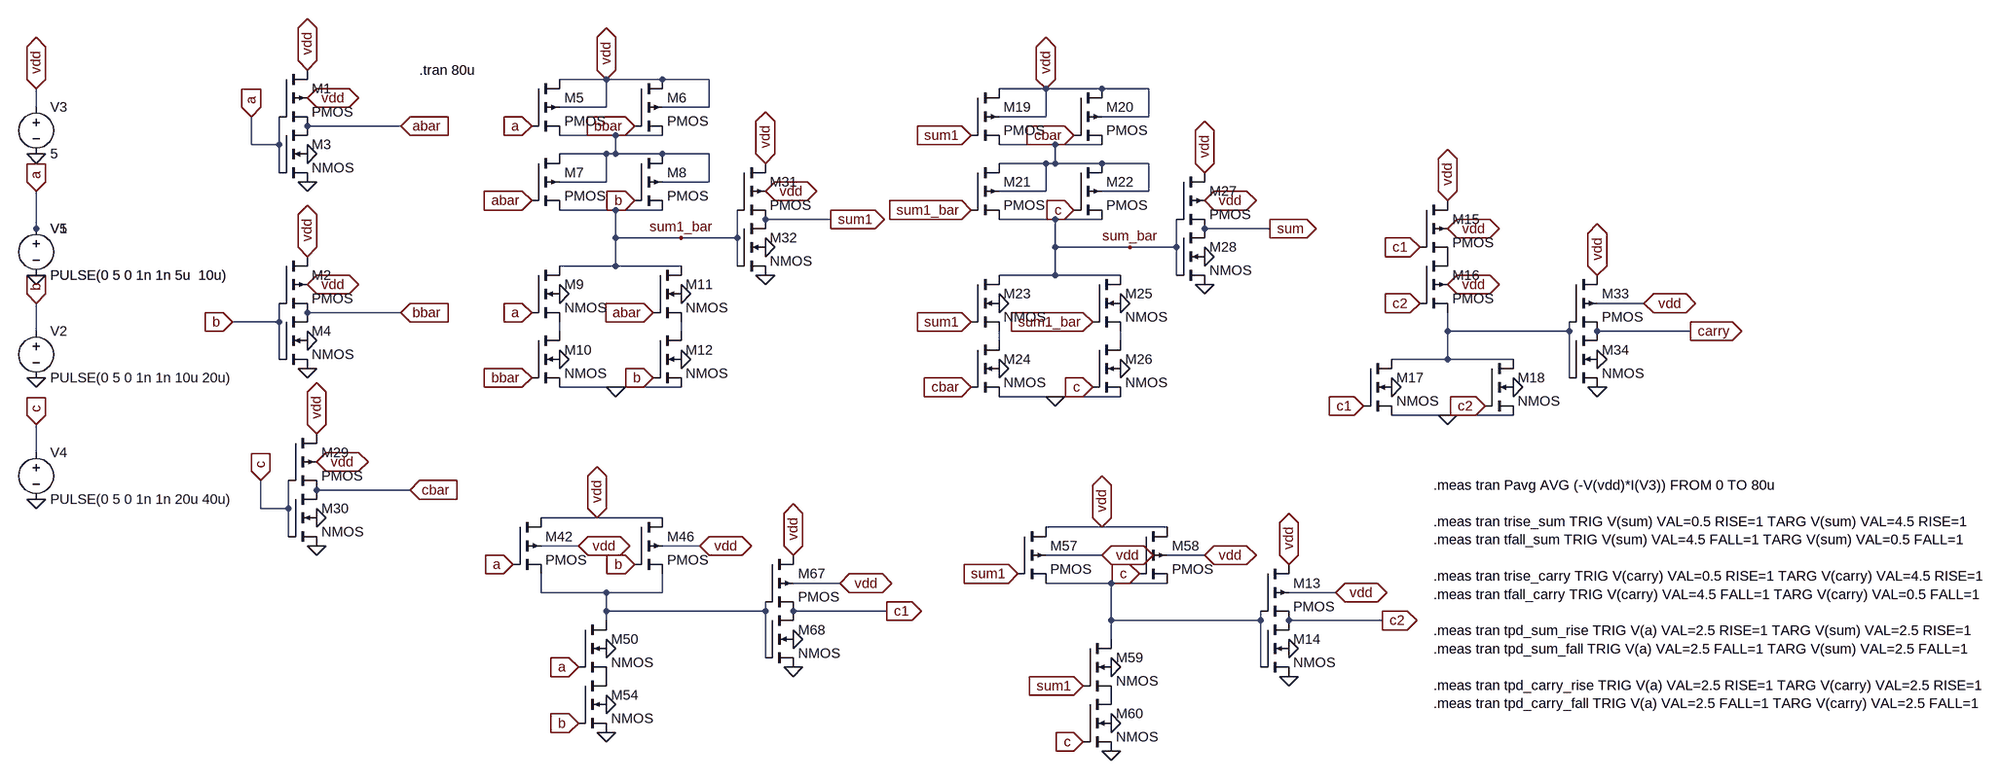
[diagram p0: schematic fulladder.asc]
fulladder.asc, the LTspice schematic file:
Version 4.1
SHEET 1 4872 1032
WIRE 752 -176 672 -176
WIRE 848 -176 752 -176
WIRE 928 -176 848 -176
WIRE 1504 -160 1424 -160
WIRE 1600 -160 1504 -160
WIRE 1680 -160 1600 -160
WIRE -224 -128 -224 -160
WIRE 752 -128 752 -176
WIRE 752 -128 672 -128
WIRE 928 -128 928 -176
WIRE 928 -128 848 -128
WIRE 1504 -112 1504 -160
WIRE 1504 -112 1424 -112
WIRE 1680 -112 1680 -160
WIRE 1680 -112 1600 -112
WIRE 400 -96 240 -96
WIRE 768 -80 672 -80
WIRE 848 -80 768 -80
WIRE 144 -64 144 -112
WIRE 192 -64 192 -112
WIRE 192 -64 144 -64
WIRE 1520 -64 1424 -64
WIRE 1600 -64 1520 -64
WIRE 752 -48 672 -48
WIRE 768 -48 768 -80
WIRE 768 -48 752 -48
WIRE 848 -48 768 -48
WIRE 928 -48 848 -48
WIRE 1504 -32 1424 -32
WIRE 1520 -32 1520 -64
WIRE 1520 -32 1504 -32
WIRE 1600 -32 1520 -32
WIRE 1680 -32 1600 -32
WIRE 192 -16 192 -64
WIRE 752 0 752 -48
WIRE 752 0 672 0
WIRE 928 0 928 -48
WIRE 928 0 848 0
WIRE 1504 16 1504 -32
WIRE 1504 16 1424 16
WIRE 1680 16 1680 -32
WIRE 1680 16 1600 16
WIRE 768 48 672 48
WIRE 848 48 768 48
WIRE 1136 64 1024 64
WIRE 1520 64 1424 64
WIRE 1600 64 1520 64
WIRE -224 80 -224 16
WIRE 1888 80 1776 80
WIRE 768 96 768 48
WIRE 880 96 768 96
WIRE 976 96 976 48
WIRE 976 96 880 96
WIRE 1520 112 1520 64
WIRE 1648 112 1520 112
WIRE 1728 112 1728 64
WIRE 1728 112 1648 112
WIRE 768 144 768 96
WIRE 768 144 672 144
WIRE 880 144 768 144
WIRE 976 144 976 96
WIRE 1520 160 1520 112
WIRE 1520 160 1424 160
WIRE 1632 160 1520 160
WIRE 1728 160 1728 112
WIRE 2528 208 2448 208
WIRE 400 224 240 224
WIRE 192 240 192 208
WIRE 192 240 112 240
WIRE -224 256 -224 208
WIRE 672 256 672 240
WIRE 880 256 880 240
WIRE 2192 256 2192 224
WIRE 2400 256 2400 240
WIRE 2400 256 2192 256
WIRE 2608 256 2448 256
WIRE 1424 272 1424 256
WIRE 1632 272 1632 256
WIRE 192 304 192 240
WIRE 2192 304 2192 256
WIRE 2192 304 2096 304
WIRE 2304 304 2192 304
WIRE 2400 336 2400 256
WIRE 768 352 672 352
WIRE 880 352 768 352
WIRE 1520 368 1424 368
WIRE 1632 368 1520 368
WIRE 2192 400 2096 400
WIRE 2304 400 2192 400
WIRE -224 464 -224 416
WIRE 416 528 256 528
WIRE 160 560 160 512
WIRE 208 560 208 512
WIRE 208 560 160 560
WIRE 736 576 640 576
WIRE 848 576 736 576
WIRE 1600 592 1504 592
WIRE 1712 592 1600 592
WIRE 208 608 208 560
WIRE 704 624 640 624
WIRE 912 624 848 624
WIRE 1600 640 1504 640
WIRE 1776 640 1712 640
WIRE 1152 688 1072 688
WIRE 1616 688 1504 688
WIRE 1712 688 1616 688
WIRE 640 704 640 672
WIRE 752 704 640 704
WIRE 848 704 848 672
WIRE 848 704 752 704
WIRE 2000 704 1920 704
WIRE 752 736 752 704
WIRE 1024 736 1024 720
WIRE 1024 736 752 736
WIRE 1232 736 1072 736
WIRE 752 752 752 736
WIRE 1616 752 1616 688
WIRE 1872 752 1872 736
WIRE 1872 752 1616 752
WIRE 2080 752 1920 752
WIRE 1616 784 1616 752
WIRE 1024 816 1024 736
WIRE 1872 832 1872 752
FLAG -224 -48 0
FLAG -224 336 0
FLAG 400 -96 abar
IOPIN 400 -96 In
FLAG -224 -160 vdd
IOPIN -224 -160 BiDir
FLAG 240 -192 vdd
IOPIN 240 -192 BiDir
FLAG 240 128 vdd
IOPIN 240 128 BiDir
FLAG 400 224 bbar
IOPIN 400 224 In
FLAG 240 0 0
FLAG 240 320 0
FLAG 144 -112 a
IOPIN 144 -112 In
FLAG 112 240 b
IOPIN 112 240 In
FLAG 240 -144 vdd
IOPIN 240 -144 BiDir
FLAG 240 -48 0
FLAG -224 208 b
IOPIN -224 208 In
FLAG 240 176 vdd
IOPIN 240 176 BiDir
FLAG 240 272 0
FLAG 752 -176 vdd
IOPIN 752 -176 BiDir
FLAG 624 -96 a
IOPIN 624 -96 In
FLAG 800 -96 bbar
IOPIN 800 -96 In
FLAG 624 32 abar
IOPIN 624 32 In
FLAG 800 32 b
IOPIN 800 32 In
FLAG 672 192 0
FLAG 672 304 0
FLAG 624 224 a
IOPIN 624 224 In
FLAG 624 336 bbar
IOPIN 624 336 In
FLAG 880 192 0
FLAG 880 304 0
FLAG 832 224 abar
IOPIN 832 224 In
FLAG 832 336 b
IOPIN 832 336 In
FLAG 768 352 0
FLAG 1024 -32 vdd
IOPIN 1024 -32 BiDir
FLAG 1024 160 0
FLAG 1024 112 0
FLAG 1024 16 vdd
IOPIN 1024 16 BiDir
FLAG 1136 64 sum1
IOPIN 1136 64 Out
FLAG 1504 -160 vdd
IOPIN 1504 -160 BiDir
FLAG 1424 208 0
FLAG 1424 320 0
FLAG 1632 208 0
FLAG 1632 320 0
FLAG 1520 368 0
FLAG 1776 -16 vdd
IOPIN 1776 -16 BiDir
FLAG 1776 176 0
FLAG 1776 128 0
FLAG 1776 32 vdd
IOPIN 1776 32 BiDir
FLAG 1888 80 sum
IOPIN 1888 80 Out
FLAG 880 96 sum1_bar
FLAG -224 416 c
IOPIN -224 416 In
FLAG -224 544 0
FLAG 1376 -80 sum1
IOPIN 1376 -80 In
FLAG 416 528 cbar
IOPIN 416 528 In
FLAG 256 432 vdd
IOPIN 256 432 BiDir
FLAG 256 624 0
FLAG 256 480 vdd
IOPIN 256 480 BiDir
FLAG 256 576 0
FLAG 160 512 c
IOPIN 160 512 In
FLAG 1552 48 c
IOPIN 1552 48 In
FLAG 1376 48 sum1_bar
IOPIN 1376 48 In
FLAG 1552 -80 cbar
IOPIN 1552 -80 In
FLAG 1376 240 sum1
IOPIN 1376 240 In
FLAG 1376 352 cbar
IOPIN 1376 352 In
FLAG 1584 240 sum1_bar
IOPIN 1584 240 In
FLAG 1584 352 c
IOPIN 1584 352 In
FLAG 1648 112 sum_bar
FLAG 736 576 vdd
IOPIN 736 576 BiDir
FLAG 592 656 a
IOPIN 592 656 In
FLAG 800 656 b
IOPIN 800 656 In
FLAG 704 832 a
IOPIN 704 832 In
FLAG 704 928 b
IOPIN 704 928 In
FLAG 752 800 0
FLAG 752 896 0
FLAG 1616 976 0
FLAG 1616 928 0
FLAG 1616 832 0
FLAG 1456 672 sum1
IOPIN 1456 672 In
FLAG 1568 864 sum1
IOPIN 1568 864 In
FLAG 1664 672 c
IOPIN 1664 672 In
FLAG 1568 960 c
IOPIN 1568 960 In
FLAG 1072 640 vdd
IOPIN 1072 640 BiDir
FLAG 1072 784 0
FLAG 1072 832 0
FLAG 1232 736 c1
IOPIN 1232 736 Out
FLAG 752 944 0
FLAG 1152 688 vdd
IOPIN 1152 688 BiDir
FLAG 704 624 vdd
IOPIN 704 624 BiDir
FLAG 912 624 vdd
IOPIN 912 624 BiDir
FLAG 1776 640 vdd
IOPIN 1776 640 BiDir
FLAG 1600 640 vdd
IOPIN 1600 640 BiDir
FLAG 1600 592 vdd
IOPIN 1600 592 BiDir
FLAG 1920 656 vdd
IOPIN 1920 656 BiDir
FLAG 1920 800 0
FLAG 1920 848 0
FLAG 2080 752 c2
IOPIN 2080 752 Out
FLAG 2000 704 vdd
IOPIN 2000 704 BiDir
FLAG 2448 160 vdd
IOPIN 2448 160 BiDir
FLAG 2448 304 0
FLAG 2448 352 0
FLAG 2608 256 carry
IOPIN 2608 256 Out
FLAG 2528 208 vdd
IOPIN 2528 208 BiDir
FLAG 2192 32 vdd
IOPIN 2192 32 BiDir
FLAG 2192 80 vdd
IOPIN 2192 80 BiDir
FLAG 2192 176 vdd
IOPIN 2192 176 BiDir
FLAG 2192 400 0
FLAG 2304 352 0
FLAG 2096 352 0
FLAG 2144 112 c1
IOPIN 2144 112 In
FLAG 2048 384 c1
IOPIN 2048 384 In
FLAG 2144 208 c2
IOPIN 2144 208 In
FLAG 2256 384 c2
IOPIN 2256 384 In
FLAG -224 160 0
FLAG -224 16 a
IOPIN -224 16 In
SYMBOL voltage -224 64 R0
WINDOW 123 0 0 Left 0
WINDOW 39 0 0 Left 0
SYMATTR InstName V1
SYMATTR Value PULSE(0 5 0 1n 1n 5u  10u)
SYMBOL voltage -224 240 R0
WINDOW 123 0 0 Left 0
WINDOW 39 0 0 Left 0
SYMATTR InstName V2
SYMATTR Value PULSE(0 5 0 1n 1n 10u 20u)
SYMBOL voltage -224 -144 R0
WINDOW 123 0 0 Left 0
WINDOW 39 0 0 Left 0
SYMATTR InstName V3
SYMATTR Value 5
SYMBOL pmos4 192 -192 R0
SYMATTR InstName M1
SYMBOL pmos4 192 128 R0
SYMATTR InstName M2
SYMBOL nmos4 192 -96 R0
SYMATTR InstName M3
SYMBOL nmos4 192 224 R0
SYMATTR InstName M4
SYMBOL pmos4 624 -176 R0
SYMATTR InstName M5
SYMBOL pmos4 800 -176 R0
SYMATTR InstName M6
SYMBOL pmos4 624 -48 R0
SYMATTR InstName M7
SYMBOL pmos4 800 -48 R0
SYMATTR InstName M8
SYMBOL nmos4 624 144 R0
SYMATTR InstName M9
SYMBOL nmos4 624 256 R0
SYMATTR InstName M10
SYMBOL nmos4 832 144 R0
SYMATTR InstName M11
SYMBOL nmos4 832 256 R0
SYMATTR InstName M12
SYMBOL pmos4 976 -32 R0
SYMATTR InstName M31
SYMBOL nmos4 976 64 R0
SYMATTR InstName M32
SYMBOL pmos4 1376 -160 R0
SYMATTR InstName M19
SYMBOL pmos4 1552 -160 R0
SYMATTR InstName M20
SYMBOL pmos4 1376 -32 R0
SYMATTR InstName M21
SYMBOL pmos4 1552 -32 R0
SYMATTR InstName M22
SYMBOL nmos4 1376 160 R0
SYMATTR InstName M23
SYMBOL nmos4 1376 272 R0
SYMATTR InstName M24
SYMBOL nmos4 1584 160 R0
SYMATTR InstName M25
SYMBOL nmos4 1584 272 R0
SYMATTR InstName M26
SYMBOL pmos4 1728 -16 R0
SYMATTR InstName M27
SYMBOL nmos4 1728 80 R0
SYMATTR InstName M28
SYMBOL voltage -224 448 R0
WINDOW 123 0 0 Left 0
WINDOW 39 0 0 Left 0
SYMATTR InstName V4
SYMATTR Value PULSE(0 5 0 1n 1n 20u 40u)
SYMBOL pmos4 208 432 R0
SYMATTR InstName M29
SYMBOL nmos4 208 528 R0
SYMATTR InstName M30
SYMBOL pmos4 592 576 R0
SYMATTR InstName M42
SYMBOL pmos4 800 576 R0
SYMATTR InstName M46
SYMBOL nmos4 704 752 R0
SYMATTR InstName M50
SYMBOL nmos4 704 848 R0
SYMATTR InstName M54
SYMBOL pmos4 1456 592 R0
SYMATTR InstName M57
SYMBOL pmos4 1664 592 R0
SYMATTR InstName M58
SYMBOL nmos4 1568 784 R0
SYMATTR InstName M59
SYMBOL nmos4 1568 880 R0
SYMATTR InstName M60
SYMBOL pmos4 1024 640 R0
SYMATTR InstName M67
SYMBOL nmos4 1024 736 R0
SYMATTR InstName M68
SYMBOL pmos4 1872 656 R0
SYMATTR InstName M13
SYMBOL nmos4 1872 752 R0
SYMATTR InstName M14
SYMBOL pmos4 2144 32 R0
SYMATTR InstName M15
SYMBOL pmos4 2144 128 R0
SYMATTR InstName M16
SYMBOL nmos4 2048 304 R0
SYMATTR InstName M17
SYMBOL nmos4 2256 304 R0
SYMATTR InstName M18
SYMBOL pmos4 2400 160 R0
SYMATTR InstName M33
SYMBOL nmos4 2400 256 R0
SYMATTR InstName M34
SYMBOL voltage -224 64 R0
WINDOW 123 0 0 Left 0
WINDOW 39 0 0 Left 0
SYMATTR InstName V5
SYMATTR Value PULSE(0 5 0 1n 1n 5u  10u)
TEXT 432 -192 Left 2 !.tran 80u
TEXT 2168 520 Left 2 !.meas tran Pavg AVG (-V(vdd)*I(V3)) FROM 0 TO 80u\n \n.meas tran trise_sum TRIG V(sum) VAL=0.5 RISE=1 TARG V(sum) VAL=4.5 RISE=1\n.meas tran tfall_sum TRIG V(sum) VAL=4.5 FALL=1 TARG V(sum) VAL=0.5 FALL=1\n \n.meas tran trise_carry TRIG V(carry) VAL=0.5 RISE=1 TARG V(carry) VAL=4.5 RISE=1\n.meas tran tfall_carry TRIG V(carry) VAL=4.5 FALL=1 TARG V(carry) VAL=0.5 FALL=1\n \n.meas tran tpd_sum_rise TRIG V(a) VAL=2.5 RISE=1 TARG V(sum) VAL=2.5 RISE=1\n.meas tran tpd_sum_fall TRIG V(a) VAL=2.5 FALL=1 TARG V(sum) VAL=2.5 FALL=1\n \n.meas tran tpd_carry_rise TRIG V(a) VAL=2.5 RISE=1 TARG V(carry) VAL=2.5 RISE=1\n.meas tran tpd_carry_fall TRIG V(a) VAL=2.5 FALL=1 TARG V(carry) VAL=2.5 FALL=1

The netlist it stands for:
* fulladder.asc
V1 a 0 PULSE(0 5 0 1n 1n 5u  10u)
V2 b 0 PULSE(0 5 0 1n 1n 10u 20u)
V3 vdd 0 5
M1 vdd a abar vdd PMOS
M2 vdd b bbar vdd PMOS
M3 abar a 0 0 NMOS
M4 bbar b 0 0 NMOS
M5 vdd a N001 vdd PMOS
M6 vdd bbar N001 vdd PMOS
M7 N001 abar sum1_bar N001 PMOS
M8 N001 b sum1_bar N001 PMOS
M9 sum1_bar a N003 0 NMOS
M10 N003 bbar 0 0 NMOS
M11 sum1_bar abar N004 0 NMOS
M12 N004 b 0 0 NMOS
M31 vdd sum1_bar sum1 vdd PMOS
M32 sum1 sum1_bar 0 0 NMOS
M19 vdd sum1 N002 vdd PMOS
M20 vdd cbar N002 vdd PMOS
M21 N002 sum1_bar sum_bar N002 PMOS
M22 N002 c sum_bar N002 PMOS
M23 sum_bar sum1 N006 0 NMOS
M24 N006 cbar 0 0 NMOS
M25 sum_bar sum1_bar N007 0 NMOS
M26 N007 c 0 0 NMOS
M27 vdd sum_bar sum vdd PMOS
M28 sum sum_bar 0 0 NMOS
V4 c 0 PULSE(0 5 0 1n 1n 20u 40u)
M29 vdd c cbar vdd PMOS
M30 cbar c 0 0 NMOS
M42 vdd a N009 vdd PMOS
M46 vdd b N009 vdd PMOS
M50 N009 a P001 0 NMOS
M54 P001 b 0 0 NMOS
M57 vdd sum1 N008 vdd PMOS
M58 vdd c N008 vdd PMOS
M59 N008 sum1 P002 0 NMOS
M60 P002 c 0 0 NMOS
M67 vdd N009 c1 vdd PMOS
M68 c1 N009 0 0 NMOS
M13 vdd N008 c2 vdd PMOS
M14 c2 N008 0 0 NMOS
M15 vdd c1 P003 vdd PMOS
M16 P003 c2 N005 vdd PMOS
M17 N005 c1 0 0 NMOS
M18 N005 c2 0 0 NMOS
M33 vdd N005 carry vdd PMOS
M34 carry N005 0 0 NMOS
V5 a 0 PULSE(0 5 0 1n 1n 5u  10u)
.model NMOS NMOS
.model PMOS PMOS
.lib standard.mos
.tran 80u
.meas tran Pavg AVG (-V(vdd)*I(V3)) FROM 0 TO 80u
.meas tran trise_sum TRIG V(sum) VAL=0.5 RISE=1 TARG V(sum) VAL=4.5 RISE=1
.meas tran tfall_sum TRIG V(sum) VAL=4.5 FALL=1 TARG V(sum) VAL=0.5 FALL=1
.meas tran trise_carry TRIG V(carry) VAL=0.5 RISE=1 TARG V(carry) VAL=4.5 RISE=1
.meas tran tfall_carry TRIG V(carry) VAL=4.5 FALL=1 TARG V(carry) VAL=0.5 FALL=1
.meas tran tpd_sum_rise TRIG V(a) VAL=2.5 RISE=1 TARG V(sum) VAL=2.5 RISE=1
.meas tran tpd_sum_fall TRIG V(a) VAL=2.5 FALL=1 TARG V(sum) VAL=2.5 FALL=1
.meas tran tpd_carry_rise TRIG V(a) VAL=2.5 RISE=1 TARG V(carry) VAL=2.5 RISE=1
.meas tran tpd_carry_fall TRIG V(a) VAL=2.5 FALL=1 TARG V(carry) VAL=2.5 FALL=1
.backanno
.end

* Results of the author's LTspice run, read from the files saved beside the schematic
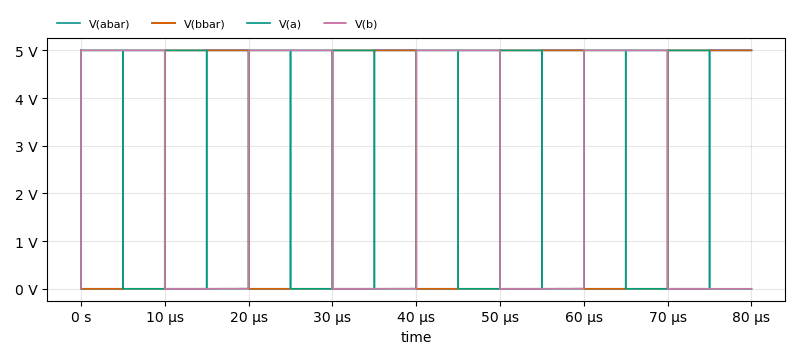
[diagram p1: Transient Analysis of fulladder.asc, plotted from the saved traces]
* Transient Analysis, 1 run:
*   V(abar): min 0 V, max 5 V, average 2.499 V, rms 3.535 V, last 5 V
*   V(bbar): min 0 V, max 5 V, average 2.5 V, rms 3.535 V, last 5 V
*   V(a): min 0 V, max 5 V, average 2.501 V, rms 3.536 V, last 0 V
*   V(b): min 0 V, max 5 V, average 2.5 V, rms 3.536 V, last 0 V
* From the log:
*   pavg: AVG(-V(vdd)*I(V3))=8.77468589274e-08 FROM 0 TO 8e-05
*   trise_sum=1.12479278489e-12 FROM 3.44842862988e-10 TO 3.45967655773e-10
*   tfall_sum=9.37726477181e-19 FROM 4.99999999568e-10 TO 5.00000000506e-10
*   trise_carry=2.58866688308e-13 FROM 6.74115427845e-10 TO 6.74374294534e-10
*   tfall_carry=8.50724223665e-13 FROM 5.001445169e-06 TO 5.00144601972e-06
*   tpd_sum_rise=-1.54594733401e-10 FROM 4.99999992781e-10 TO 3.4540525938e-10
*   tpd_sum_fall=-5.001e-06 FROM 5.0015e-06 TO 5.00000000037e-10
*   tpd_carry_rise=1.7425117492e-10 FROM 4.99999992781e-10 TO 6.74251167701e-10
*   tpd_carry_fall=-5.44056382748e-11 FROM 5.0015e-06 TO 5.00144559436e-06